# EasyEDA Pro project ProPrj_CraftVia-Core-S-RP235xA-v1-Rev0_2026-11-04.epro, board PCB1
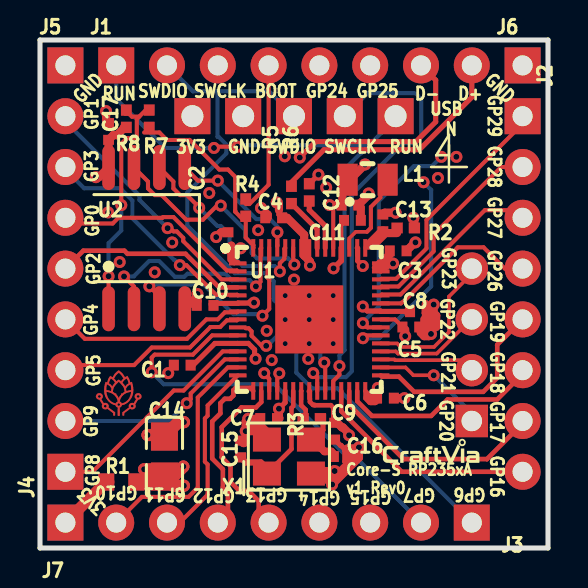
[diagram p2: board, top side]
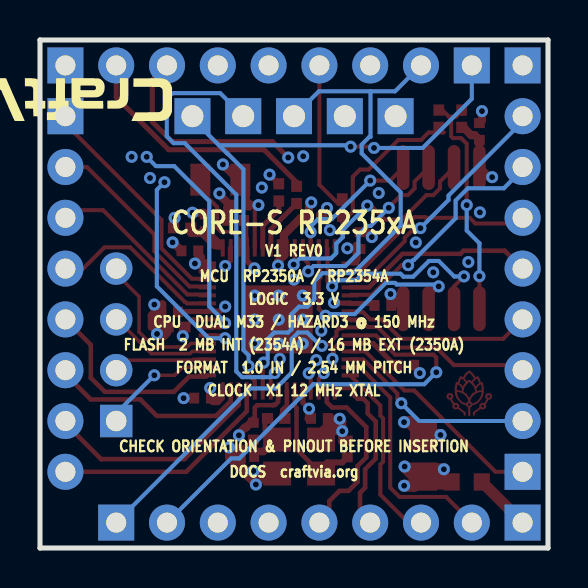
[diagram p3: board, bottom side, seen from below]

Outline 25.4 x 25.4 mm; copper layers: Top Layer, GND Plane, Power / Signal, Bottom Layer. Coordinates in mm from the lower left corner of the outline.
Outline path: 0,25.4 25.4,25.4 25.4,0 0,0 0,25.4
Stack: Top Layer 0.035mm Outer layer thickness 1oz / Dielectric1 0.2104mm 7628 RC49% 8.6mil / GND Plane 0.0175mm / Dielectric2 1.065mm 1.1mm H/HOZ Copper / Power / Signal 0.0175mm / Dielectric3 0.2104mm 7628 RC49% 8.6mil / Bottom Layer 0.035mm Outer layer thickness 1oz

## Design rules (mm)
net GND: PWR_MAIN
net USB_DM: USB, USB_IO
net USB_DP: USB, USB_IO
net +3V3_IN: PWR_MAIN
net +3V3_CORE: PWR_MAIN
net +1V1: PWR_MAIN
net VREG_AVDD: ANALOG_POWER
net XIN: CLOCK
net XOUT_XTAL: CLOCK
net VREG_LX: PWR_SWITCH
net XOUT: CLOCK
net USB_DP_MCU: USB, USB_MCU
net USB_DM_MCU: USB, USB_MCU
spacing copperThickness1oz (default): track to track 0.152, other pairs 0.152 to 0.3
spacing copperThickness2oz: track to track 0.203, other pairs 0.152 to 0.3
track width copperThickness1oz (default): min 0.152, default 0.203, max 2.54
track width copperThickness2oz: min 0.203, default 0.254, max 2.54
track width powerTrack: min 0.178, default 0.406, max 2.54
track width gndTrack: min 0.178, default 0.406, max 2.54
track width corePowerTrack: min 0.178, default 0.406, max 2.54
differential pair differentialPair (default): width min 0.127, default 0.254, max 2.54; gap min 0.152, default 0.152
net GND uses powerTrack
net +3V3_IN uses powerTrack
net +3V3_CORE uses copperRegion, powerTrack
net +1V1 uses copperRegion, powerTrack
net VREG_AVDD uses powerTrack
net VREG_LX uses powerTrack
net class PWR_MAIN uses powerTrack
net class PWR_SWITCH uses powerTrack
net class ANALOG_POWER uses powerTrack

## Placement (name value [footprint] x y rotation side)
C1  100n  [C0402]  7.11 9.14 180 top
C2  100n  [C0402]  9.4 15.37 90 top
C3  100n  [C0402]  17.91 14.86 0 top
C4  100n  [C0402]  11.68 16.51 180 top
C5  100n  [C0402]  18.54 11.05 0 top
C6  100n  [C0402]  17.27 7.49 0 top
C7  100n  [C0402]  11.43 6.48 180 top
C8  100n  [C0402]  18.92 11.81 0 top
C9  100n  [C0402]  14.73 5.84 270 top
C10  100n  [C0402]  8.25 12.13 180 top
C11  4.7u  [C0402]  15.62 16.38 0 top
C12  4.7u  [C0402]  15.49 17.14 0 top
C13  4.7u  [C0402]  17.15 16.26 90 top
C14  10u  [C0805]  6.22 4.57 90 top
C15  15p  [C0402]  10.03 4.95 90 top
C16  15p  [C0402]  15.11 4.57 0 top
C17  100nF  [C0402]  3.43 20.83 270 top
J1  N 1-8  [HDR-TH_8P-P2.54-V-M]  12.7 24.13 0 top
J2  E 1-8  [HDR-TH_8P-P2.54-V-M]  24.13 12.7 270 top
J3  S 1-8  [HDR-TH_8P-P2.54-V-M]  12.7 1.27 180 top
J4  W 1-8  [HDR-TH_8P-P2.54-V-M]  1.27 12.7 90 top
J5  K-NW  [CraftVia-Core-S-KEY-TH_1P-P2.54-D1.00-P1.80]  1.27 24.13 0 top
J6  K-NE  [CraftVia-Core-S-KEY-TH_1P-P2.54-D1.00-P1.80]  24.13 24.13 0 top
J7  K-SW  [CraftVia-Core-S-KEY-TH_1P-P2.54-D1.00-P1.80]  1.27 1.27 0 top
J8  AUX GPIO20-23 / 2.54mm PTH  [HDR-TH_HDR-M_2.54_1X4P]  21.59 10.16 90 top
L1  3.3uH  [IND-SMD_L2.0-W1.6_AOTA-B201610S3R3-101-T]  16.38 18.42 180 top
R1  0R  [R0603]  4.06 3.3 0 top
R2  33  [R0402]  18.29 16 180 top
R3  1k  [R0402]  13.59 6.48 180 top
R4  1k  [R0402]  10.29 17.02 90 top
R5  27  [R0402]  12.57 17.65 270 top
R6  27  [R0402]  13.46 17.78 270 top
R7  0Ω  [R0402]  5.46 21.46 90 top
R8  10kΩ  [R0402]  4.32 21.46 90 top
TP1  VTREF (+3V3_CORE)  [HDR-TH_1P-P2.54-V-M]  7.62 21.59 0 top
TP2  GND  [HDR-TH_1P-P2.54-V-M]  10.16 21.59 0 top
TP3  SWDIO  [HDR-TH_1P-P2.54-V-M]  12.7 21.59 0 top
TP4  SWCLK  [HDR-TH_1P-P2.54-V-M]  15.24 21.59 0 top
TP5  RUN  [HDR-TH_1P-P2.54-V-M]  17.78 21.59 0 top
U1  RP2354A  [QFN-60_L7.0-W7.0-P0.40-TL-EP3.4]  13.46 11.43 0 top
U2  W25Q128JVSIQ (RP2350A ONLY / DNP FOR RP2354A)  [SOIC-8_L5.3-W5.3-P1.27-LS8.0-BL]  5.33 15.49 0 top
X1  12MHz  [CRYSTAL-SMD_4P-L3.2-W2.5-BL]  12.45 4.57 0 top

## Footprints (pads in the part's own frame, mm; a bottom-side part is the same pattern mirrored in y, then rotated)
C0402
  rect 0.5x0.54 smd: 1(-0.42,0) 2(0.42,0)
C0805
  rect 1.41x1.35 smd: 1(-1,0) 2(1,0)
CraftVia-Core-S-KEY-TH_1P-P2.54-D1.00-P1.80
  rect 1.801x1.801 hole 1: 1(0,0)
CRYSTAL-SMD_4P-L3.2-W2.5-BL
  rect 1.4x1.2 smd: 1(-1.1,-0.85) 2(1.1,-0.85) 3(1.1,0.85) 4(-1.1,0.85)
HDR-TH_1P-P2.54-V-M
  rect 1.8x1.8 hole 1.1: 1(0,0)
HDR-TH_8P-P2.54-V-M
  rect 1.8x1.8 hole 1: 1(-8.89,0)
  round 1.801 hole 1: 2(-6.35,0) 3(-3.81,0) 4(-1.27,0) 5(1.27,0) 6(3.81,0) 7(6.35,0) 8(8.89,0)
HDR-TH_HDR-M_2.54_1X4P
  rect 1.62x1.62 hole 1.02: 1(-3.81,0)
  round 1.62 hole 1.02: 2(-1.27,0) 3(1.27,0) 4(3.81,0)
IND-SMD_L2.0-W1.6_AOTA-B201610S3R3-101-T
  rect 1x1.6 smd: 1(-1,0) 2(1,0)
QFN-60_L7.0-W7.0-P0.40-TL-EP3.4
  rect 0.875x0.2 smd: 1(-3.575,2.8) 2(-3.575,2.4) 3(-3.575,2) 4(-3.575,1.6) 5(-3.575,1.2) 6(-3.575,0.8) 7(-3.575,0.4) 8(-3.575,0) 9(-3.575,-0.4) 10(-3.575,-0.8) 11(-3.575,-1.2) 12(-3.575,-1.6) 13(-3.575,-2) 14(-3.575,-2.4) 15(-3.575,-2.8) 31(3.575,-2.8) 32(3.575,-2.4) 33(3.575,-2.001) 34(3.575,-1.6) 35(3.575,-1.2) 36(3.575,-0.8) 37(3.575,-0.4) 38(3.575,-0.001) 39(3.575,0.4) 40(3.575,0.8) 41(3.575,1.2) 42(3.575,1.6) 43(3.575,2) 44(3.575,2.4) 45(3.575,2.8)
  rect 0.2x0.875 smd: 16(-2.8,-3.575) 17(-2.4,-3.575) 18(-2,-3.575) 19(-1.6,-3.575) 20(-1.2,-3.575) 21(-0.8,-3.575) 22(-0.4,-3.575) 23(0,-3.575) 24(0.4,-3.575) 25(0.8,-3.575) 26(1.2,-3.575) 27(1.6,-3.575) 28(2,-3.575) 29(2.4,-3.575) 30(2.8,-3.575) 46(2.8,3.575) 47(2.4,3.575) 48(2,3.575) 49(1.6,3.575) 50(1.2,3.575) 51(0.8,3.575) 52(0.4,3.575) 53(0,3.575) 54(-0.4,3.575) 55(-0.8,3.575) 56(-1.2,3.575) 57(-1.6,3.575) 58(-2,3.575) 59(-2.4,3.575) 60(-2.8,3.575)
  rect 3.4x3.4 smd: 61(0,0)
R0402
  rect 0.566x0.54 smd: 1(-0.433,0) 2(0.433,0)
R0603
  rect 0.806x0.864 smd: 1(-0.753,0) 2(0.753,0)
SOIC-8_L5.3-W5.3-P1.27-LS8.0-BL
  oval 0.63x2.25 smd: 1(-1.905,-3.53) 2(-0.635,-3.53) 3(0.635,-3.53) 4(1.905,-3.53) 5(1.905,3.53) 6(0.635,3.53) 7(-0.635,3.53) 8(-1.905,3.53)

## Nets
As in the schematic.

## Via types
v1: diameter 0.6, hole 0.25, Top Layer to Bottom Layer, 9 vias
v2: diameter 0.6, hole 0.3, Top Layer to Bottom Layer, 79 vias
v3: diameter 0.6, hole 0.299, Top Layer to Bottom Layer, 4 vias

## Routing (per net, layer and track width the routed paths; a pad name or vN(x,y) marks a point on that pad's centre or on a via; arc(x,y) is an arc through that point)
+1V1: length 43.1
  Top Layer w0.203: 14.66,15 14.66,16.87 ; 15.11,17.32 15.01,17.21
  Top Layer w0.229: 14.73,6.39 14.66,6.46 14.66,7.02 14.54,7.14 13.74,7.14 13.73,7.15 13.65,7.15 13.5,7.31 13.49,7.84 13.44,7.84
  Top Layer w0.254: 10.73,12.33 10.52,12.33 10.44,12.25 9.91,12.25 U1.6 8.59,12.23 8.55,12.19 ; C8.1 18.25,11.81 18.23,11.83 U1.39 17.02,11.85 16.36,11.85 v2(16.14,12.07)
  Top Layer w0.406: v2(14.48,17.14) 14.94,17.14 15.01,17.21 C12.1 ; v2(15.45,5.64) 15.45,5.72 15.15,6.03 15.09,6.03 14.73,6.39 ; 15.11,17.32 15.11,18.27 15.26,18.42 ; v2(16.26,19.18) 15.49,18.42
  Power / Signal w0.178: 12.87,12.56 12.87,12.67 12.92,12.72 12.92,12.84 13.24,13.16 13.37,13.16 13.5,13.3
  Power / Signal w0.254: 12.97,12.04 12.02,12.04 11.79,12.27 v2(10.7,12.27)
  Power / Signal w0.28: 12.97,12.04 12.87,12.14 12.87,12.56 ; 12.97,12.04 12.85,11.93 12.85,11.17 13.2,10.83 14.04,10.83 ; 12.97,12.04 12.98,12.03 14.05,12.03 ; 12.7,10.67 12.85,10.51 12.85,9.97 12.7,9.82 12.7,9.65 ; 14.05,12.03 14.05,12.83 ; 14.05,12.03 14.05,10.84 14.04,10.83 ; 14.22,12.03 15.58,12.03 15.62,12.06 ; 14.04,10.83 15.35,10.83 15.49,10.96
  Power / Signal w0.406: v2(16.26,19.18) 14.96,17.89 14.96,17.75 14.48,17.27 v2(14.48,17.14) 14.48,14.68 14.34,14.54 arc(15.24,14.32) 15.02,13.42 arc(14.94,13.38) 14.86,13.35 v2(16.14,12.07) 15.96,11.9 15.87,11.9 15.32,11.34 15.32,11.13 15.49,10.96 15.49,9.51 15.63,9.37 15.63,8.83 15.45,8.65 v2(15.45,5.64)
+3V3_CORE: length 29.3
  Top Layer w0.178: 15.06,15 15.07,15.02 ; 15.07,15.48 15.07,16.38
  Top Layer w0.203: U1.38 17.75,11.43 18.26,10.92 ; U1.30 16.28,7.86 16.64,7.49 C6.1
  Top Layer w0.229: U1.44 17.3,14.1
  Top Layer w0.254: v2(11.95,6.97) 12.26,7.27 12.26,7.85 ; C4.1 11.95,16.67 11.95,16.89 ; C1.1 7.66,9.14 8.75,10.23 U1.11 10.42,10.23 10.73,9.92 10.73,9.51 v2(10.78,9.46) ; 9.72,14.29 9.89,14.29 ; 15.07,15.02 15.07,15.48
  Top Layer w0.28: 15.06,15 15.06,14.37 v2(14.68,13.98)
  Top Layer w0.305: 9.57,14.44 9.72,14.29
  Top Layer w0.406: 9.57,14.44 9.57,15.12 C2.1 ; 17.3,14.1 17.04,14.1 17.16,14.22 ; 11.98,6.48 11.95,6.51 v2(11.95,6.97) ; 17.34,14.53 17.49,14.68 C3.1 ; 17.16,14.22 17,14.22 16.8,14.02 ; 17.16,14.22 v2(17.65,14.22) ; 4.19,21.03 4.19,20.99 3.85,20.64 3.66,20.64 C17.2 U2.8 2.95,18.54 v2(2.79,18.54) ; 11.95,16.89 11.95,17.17 v2(11.84,17.28) ; 18.26,10.92 v2(18.26,10.59) ; 16.38,7.5 16.53,7.34 16.74,7.34 16.89,7.49 v2(16.89,8) ; 12.23,16.51 12.36,16.51 13.21,15.66 13.21,14.62 13.21,14.62 13.41,14.42 13.41,14.42 13.5,14.33 v2(13.5,14.12) ; v2(18.67,16.51) 18.72,16.46 R2.1
  Top Layer w0.61: C14.1 6.67,3.57 v2(7.17,4.07) ; C14.1 6.68,3.11 v2(7.19,3.11) ; C14.1 5.86,3.94 v2(5.21,3.94)
  Top Layer w0.762: 4.94,3.3 5.95,3.3 ; 5.95,3.3 6.08,3.3 ; 5.95,3.3 C14.1
  Power / Signal w0.406: v2(14.68,13.98) 14.67,13.98 14.1,13.98 13.96,14.12 v2(13.5,14.12)
  vias: v2(10.03,14.99)
+3V3_IN: length 2.9
  Top Layer w0.559: 3.43,3.3 3.44,3.3 ; J7.1 3.3,3.3
GND: length 26.7
  Top Layer w0.254: 15.86,15 15.88,14.98 15.88,14.36 v2(16.14,14.1) ; C9.2 15.03,5.12 15.06,5.12 15.22,4.96 15.22,4.93 15.24,4.91 15.24,4.32 15.38,4.18
  Top Layer w0.406: 10.54,5.97 10.72,6.15 ; 13.8,3.85 14.31,3.85 14.31,3.47 v2(14.6,3.17) 14.66,3.23 ; v2(16.43,17.73) 16.43,17.66 C12.2 16.04,17.02 C11.2 ; C13.2 17.23,16.76 v2(17.78,16.76) ; v2(19.55,10.7) 19.55,11.35 19.34,11.56 19.34,11.76 ; v2(19.55,10.7) 19.44,10.59 19.21,10.59 19.04,10.76 ; v2(19.55,10.7) 19.22,11.04 19.22,11.43 ; 7.87,12.6 U2.4 ; 7.87,12.6 v2(7.87,12.7) ; 7.87,12.6 7.87,12.36 7.71,12.19 ; 19.56,11.92 19.43,11.92 ; 19.56,11.92 19.4,11.76 19.34,11.76 ; 19.56,11.92 19.56,12.04 v2(19.69,12.17) 19.69,11.75 19.81,11.62 19.81,11.05 ; 15.37,4.98 15.9,4.98 v2(15.95,5.03) 15.95,4.52 14.66,3.23 ; 14.66,3.23 14.66,3.77 v2(14.73,3.85) 15.06,3.85 15.38,4.18 15.53,4.33 15.53,4.7 ; v2(10.29,5.84) 10.29,6.33 v2(10.41,6.46) 10.99,6.46 C7.2 ; v2(10.29,5.84) 10.93,5.84 11.05,5.72 ; v2(10.29,5.84) 10.29,5.33 10.2,5.25 10.16,5.25 ; v2(8.81,15.55) 9.05,15.79 C2.2 ; v2(3.3,21.84) 3.3,21.38 C17.1 ; 11.05,6.1 11.35,5.8 X1.4 ; C6.2 v2(18.22,7.49) ; v2(11.05,17) 11.39,16.66 11.39,16.51 ; 19.34,11.76 19.29,11.76 19.29,12.19 ; 19.34,11.76 C8.2 ; C3.2 18.75,15.28 v2(18.77,15.28)
  Top Layer w0.61: v2(5.38,5.65) 6.27,5.65 6.91,6.29 v2(7.2,6.29)
  vias: v1(12.26,12.62) v1(12.26,11.42) v1(12.26,10.22) v1(13.46,12.62) v1(13.46,11.42) v1(13.46,10.22) v1(14.66,12.62) v1(14.66,11.42) v1(14.66,10.22) v2(3.41,16.78) v2(3.98,14.3) v2(5.74,13.78) v2(6.41,8.74) v2(6.61,15.28) v2(8.46,17.75) v2(10.91,15.89) v2(11.34,10.86) v2(11.59,9.39) v2(12.7,13.42) v2(13.41,9.46) v2(14.31,18.02) v2(19.9,18.5) v2(20.82,19.56) v3(12.24,19.59)
BOOTSEL_REQ: length 7.5
  Top Layer w0.203: 10.29,17.2 10.47,17.2 11.43,18.16 J1.4
CV_E1_GPIO29_ADC3: length 11.5
  Top Layer w0.203: J2.1 24.13,21.21 19.33,16.4 19.33,14.98 17.81,13.46 17.07,13.46 U1.43
CV_E2_GPIO28_ADC2: length 10.1
  Top Layer w0.203: J2.2 23.06,19.05 19.68,15.67 19.68,14.83 17.92,13.07 17.08,13.07 U1.42
CV_E3_GPIO27_ADC1: length 9
  Top Layer w0.203: U1.41 17.08,12.67 18.03,12.67 22.24,16.89 23.75,16.89 J2.3
CV_E4_GPIO26_ADC0: length 8.7
  Top Layer w0.203: J2.4 23.24,13.97 22.18,15.03 20.89,15.03 18.18,12.32 arc(18.11,12.29) 18.05,12.23 U1.40
CV_E5_GPIO19: length 9.9
  Top Layer w0.229: U1.31 17.1,8.57 17.95,8.57 18.71,7.81 22.16,7.81 22.86,8.51 22.86,10.16 J2.5
CV_E6_GPIO18: length 10.1
  Top Layer w0.229: U1.29 15.86,7.34 16.6,6.6 19.56,6.6 20.38,7.43 22.86,7.43 24.13,8.7 J2.6
CV_E7_GPIO17: length 11.4
  Top Layer w0.229: 22.35,4.44 22.35,4.44 ; 22.35,4.44 18.18,4.44 15.46,7.16 U1.28 ; 22.35,4.44 24.13,6.23 J2.7
CV_E8_GPIO16: length 11.3
  Top Layer w0.229: J2.8 18.09,3.81 15.06,6.84 U1.27
CV_S1_GPIO6: length 17
  Top Layer w0.203: 10.29,10.98 10.43,10.98 10.58,10.83 10.58,10.61 11.08,10.11 v2(11.31,10.11)
  Bottom Layer w0.203: J3.1 14.88,7.98 13.6,7.98 12.82,8.77 12.82,10.45 12.49,10.77 12.03,10.77 11.57,10.31 11.51,10.31 v2(11.31,10.11)
CV_S2_GPIO7: length 22.1
  Top Layer w0.203: U1.10 8.61,10.63 7.64,9.67 5.73,9.67 5.59,9.52 v2(5.59,8.79)
  Bottom Layer w0.203: J3.2 15.84,4.48 15.44,4.48 11.73,8.19 6.18,8.19 v2(5.59,8.79)
CV_S3_GPIO15: length 10.8
  Top Layer w0.203: v2(11.96,8.73) 11.86,8.63 U1.19
  Power / Signal w0.229: J3.3 15.17,2.61 14.24,2.61 13.84,3.01 13.84,6.65 11.96,8.53 v2(11.96,8.73)
CV_S4_GPIO14: length 10.1
  Top Layer w0.203: U1.18 11.46,8.45 11.41,8.5 11.41,8.54 v2(11.21,8.74)
  Power / Signal w0.229: J3.4 13.97,2.03 12.7,3.3 12.7,4.83 13.34,5.46 13.34,6.48 11.21,8.6 v2(11.21,8.74)
CV_S5_GPIO13: length 9.1
  Top Layer w0.229: J3.5 10.94,1.77 10.94,2.35 10.43,2.86 9.97,2.86 9.53,3.3 9.53,4.09 9.09,4.53 9.09,6.04 10.07,7.03 10.79,7.03 11.06,7.29 U1.17
CV_S6_GPIO12: length 8.9
  Top Layer w0.229: U1.16 10.52,8 9.78,8 9.67,7.89 9.67,7.62 9.51,7.46 9.24,7.46 9.02,7.24 9.02,6.73 8.61,6.33 8.61,4.47 9.14,3.94 9.14,3.02 9.4,2.76 9.4,1.78 J3.6
CV_S7_GPIO11: length 9.3
  Top Layer w0.203: U1.15 8.38,7.12 8.38,6.62 8.24,6.48 8.24,4.32 8.38,4.18 8.38,2.67 6.99,1.27 6.35,1.27
CV_S8_GPIO10: length 11.9
  Top Layer w0.203: J3.8 5.09,2.55 7.42,2.55 7.89,3.02 7.89,7.53 9.39,9.03 U1.14
CV_W1_GPIO8: length 11.1
  Top Layer w0.203: J4.1 2.62,3.81 5.16,6.35 5.19,6.35 5.33,6.5 5.33,6.52 6.69,7.87 7.18,7.87 9.13,9.83 U1.12
CV_W2_GPIO9: length 9.9
  Top Layer w0.203: U1.13 9.24,9.43 7.53,7.72 7.53,7.44 v2(7.33,7.24)
  Bottom Layer w0.203: J4.2 6.32,6.35 ; 6.45,6.35 v2(7.33,7.24)
CV_W3_GPIO5: length 9.7
  Top Layer w0.203: U1.8 9.84,11.38 9.34,11.38 9.01,11.05 8.52,11.05 7.5,10.02 5.58,10.02 4.7,9.14 1.52,9.14 J4.3
CV_W4_GPIO4: length 9.6
  Top Layer w0.203: J4.4 2.24,10.46 7.35,10.46 8.32,11.43 8.89,11.43 9.24,11.79 9.84,11.79 U1.7
CV_W5_GPIO2: length 9.7
  Top Layer w0.229: U1.4 8.95,13.03 7.27,14.71 4.37,14.71 4.22,14.86 2.16,14.86 J4.5
CV_W6_GPIO0: length 10
  Top Layer w0.203: U1.2 9.84,13.88 9.34,13.88 6.67,16.55 6.15,16.55 6.11,16.51 3.92,16.51 3.64,16.23 1.81,16.23 1.52,16.51 J4.6
CV_W7_GPIO3: length 11.9
  Top Layer w0.203: v2(6.99,14.14) 7.32,14.14 8.8,12.66 9.86,12.66 U1.5
  Bottom Layer w0.203: v2(6.99,14.14) 6.73,14.4 6.7,14.4 4.62,16.49 4.62,17.37 4,17.99 2.21,17.99 1.27,18.92 J4.7
CV_W8_GPIO1: length 12.4
  Top Layer w0.203: U1.3 9.07,13.43 7.16,15.34 7.16,15.51 6.84,15.83 6.67,15.83 6.51,15.99 v2(6.38,15.99)
  Bottom Layer w0.203: v2(6.38,15.99) 4.97,17.4 4.97,17.62 1.27,21.33 J4.8
FLASH_CS_EXT: length 11.9
  Top Layer w0.203: v2(4.06,17.14) 4.06,20.21 4.34,20.49 4.75,20.49 4.84,20.59 4.84,21.45 4.96,21.57 ; 4.19,21.9 4.19,21.79 4.27,21.72 4.44,21.72 4.59,21.57 4.96,21.57 ; 4.96,21.57 5.29,21.9 5.33,21.9 ; U2.1 v2(3.43,13.59)
  Bottom Layer w0.203: v2(3.43,13.59) 3.43,15.24 4.06,15.88 v2(4.06,17.14)
GPIO20: length 5.9
  Top Layer w0.178: U1.32 18.28,9.03 18.67,8.64 v2(19.69,8.64)
  Bottom Layer w0.203: 21.72,6.35 21.72,6.6 v2(19.69,8.64)
GPIO21: length 5
  Top Layer w0.178: 21.72,8.89 21.72,9.09 21.42,9.39 17.76,9.39 17.72,9.43 U1.33
GPIO22: length 5.4
  Top Layer w0.178: 21.72,11.43 21.54,11.43 19.84,9.72 17.9,9.72 17.79,9.83 U1.34
GPIO23: length 7.5
  Top Layer w0.178: 21.72,13.97 21.72,13.84 20.45,12.57 20.45,10.8 19.7,10.05 18.04,10.05 17.86,10.23 17.04,10.23 U1.35
GPIO24: length 19.9
  Top Layer w0.203: v2(16.15,10.49) 16.29,10.63 U1.36
  Power / Signal w0.203: v2(19.18,18.29) 19.18,19.05 17.79,20.44 16.71,20.44 16.51,20.64 16.51,22.48 16.13,22.86 15.24,22.86 J1.5
  Bottom Layer w0.203: v2(19.18,18.29) 19.56,17.91 19.56,13.08 16.97,10.49 v2(16.15,10.49)
GPIO25: length 18
  Top Layer w0.203: v2(16.14,11.24) 16.34,11.04 16.38,11.04 16.39,11.03 U1.37
  Power / Signal w0.203: J1.6 17.89,22.75 18.81,22.75 19.18,22.37 19.18,21.59 20.07,20.7 v2(20.07,19.56)
  Bottom Layer w0.203: v2(16.14,11.24) 16.14,11.29 16.94,12.09 16.94,17.34 18.69,19.1 19.6,19.1 v2(20.07,19.56)
QSPI_SCLK: length 10.2
  Top Layer w0.203: v2(7.96,17.01) 7.96,17.03 7.35,17.64 7,17.64 6.67,17.98 6.67,18.32 U2.6 ; 12.26,15 12.22,14.96 12.22,14.46 11.99,14.24 v2(11.99,13.83)
  Bottom Layer w0.203: v2(7.96,17.01) 8.87,16.1 9.04,16.1 9.48,15.66 9.48,14.76 10.14,14.1 11.73,14.1 v2(11.99,13.83)
QSPI_SD0: length 6.8
  Top Layer w0.203: v2(11.87,15.79) 11.87,15.11 11.86,15.11 ; U2.5 7.89,18.37 v2(8.89,18.37)
  Bottom Layer w0.203: v2(8.89,18.37) 10.81,16.45 11.49,16.45 11.87,16.07 v2(11.87,15.79)
QSPI_SD1: length 11.4
  Top Layer w0.203: U2.2 4.7,13.08 v2(4.2,13.58) ; 11.06,15 11.02,14.97 11.02,13.31 v2(10.79,13.08)
  Bottom Layer w0.203: v2(10.79,13.08) 10.49,13.39 9.6,13.39 9.27,13.72 7.37,13.72 7.22,13.56 6.74,13.56 5.95,14.35 5.46,14.35 4.69,13.58 v2(4.2,13.58)
QSPI_SD2: length 11.3
  Top Layer w0.203: U2.3 5.97,12.58 v2(5.47,13.08) ; v2(11.12,11.61) 11.46,11.95 11.46,13.43 11.38,13.51 11.38,14.09 11.46,14.17 11.46,15
  Bottom Layer w0.203: v2(11.12,11.61) 10.99,11.61 10.91,11.69 9.67,11.69 8.1,13.25 7.64,13.25 7.56,13.17 5.56,13.17 v2(5.47,13.08)
QSPI_SD3: length 12.2
  Top Layer w0.203: v2(12.72,14.17) 12.66,14.23 12.66,15 ; U2.7 5.4,18.32 5.4,17.98 5.73,17.64 6.08,17.64 7.31,16.42 8.15,16.42 8.85,17.12 v2(9.04,17.12)
  Bottom Layer w0.203: v2(9.04,17.12) 10.26,15.89 10.26,15.54 10.59,15.22 10.59,14.75 10.85,14.48 12.41,14.48 v2(12.72,14.17)
QSPI_SS: length 9.4
  Top Layer w0.203: R4.1 10.16,16.46 10.11,16.46 9.76,16.81 9.76,16.86 9.76,16.86 9.76,18.56 9.4,18.92 8.96,18.92 7.48,20.4 6.34,20.4 5.97,20.78 5.21,20.78 ; 10.29,16.33 10.29,15.52 10.67,15.13 10.67,15.01 10.66,15
RUN: length 30.5
  Top Layer w0.203: v2(9.87,20.07) 8.76,20.07 v2(8.7,20) ; U1.26 14.66,8.35 14.97,8.66 v3(14.97,9.1)
  Bottom Layer w0.203: v2(8.7,20) 6.26,20 3.81,22.46 J1.1 ; 16.45,20.14 17.91,21.59 ; 16.45,20.14 16.05,19.73 16.03,19.73 15.23,18.93 15.23,9.9 14.97,9.64 v3(14.97,9.1) ; 16.45,20.14 9.94,20.14 v2(9.87,20.07)
SWCLK: length 30.5
  Top Layer w0.203: v3(13.66,8.74) 13.86,8.54 U1.24
  Power / Signal w0.203: J1.3 8.89,23.75 9.66,22.98 13.86,22.98 TP4.1
  Bottom Layer w0.203: v3(13.66,8.74) 13.86,8.54 15.29,8.54 15.59,8.83 15.59,17.67 18.16,20.24 18.72,20.24 19.06,20.58 19.06,20.64 ; 19.06,20.64 19.06,22.49 ; 19.06,20.64 19.05,20.63 ; TP4.1 16.39,22.75 18.68,22.75 arc(18.86,22.67) 18.93,22.49
SWDIO: length 27.8
  Top Layer w0.203: v3(14.21,9.27) 14.26,9.22 U1.25
  Bottom Layer w0.203: 8.87,22.83 8.87,20.56 8.93,20.56 9.32,20.17 9.32,19.73 7.37,17.78 7.37,16.12 9.74,13.74 11.28,13.74 11.68,13.33 11.68,12.45 11.71,12.42 11.71,12.39 12.03,12.07 12.45,12.07 12.83,11.68 12.83,10.94 12.99,10.77 13.69,10.77 14.02,10.45 14.02,9.47 v3(14.21,9.27) ; 8.87,22.83 7.65,22.83 J1.2 ; 8.87,22.83 11.46,22.83 TP3.1
USB_DM: length 12.7
  Top Layer w0.254: 13.59,18.09 13.59,18.34 v2(13.92,18.67) ; J1.7 19.78,23.39 19.78,21.31 18.8,20.32 13.79,20.32 v2(12.99,19.52)
  Power / Signal w0.254: v2(12.99,19.52) 13.84,18.67 v2(13.92,18.67)
USB_DM_MCU: length 2.7
  Top Layer w0.254: R6.2 13.46,16.91 14.26,16.11 14.26,15
USB_DP: length 12.6
  Top Layer w0.254: J1.8 21.59,22.54 18.96,19.91 14.2,19.91 12.57,18.29 R5.1
USB_DP_MCU: length 2.7
  Top Layer w0.254: 13.86,15 13.86,15.94 R5.2
VREG_AVDD: length 2.7
  Top Layer w0.178: 16.26,15 16.53,15 16.66,15.13
  Top Layer w0.406: 17.85,15.75 17.27,15.75 16.66,15.13
  Top Layer w0.482: 16.55,15.24 C13.1
VREG_LX: length 4.5
  Top Layer w0.178: 16.35,15.81 15.79,15.81 15.46,15.48 15.46,15
  Top Layer w0.203: L1.1 17.02,18.05 17.02,17.53 16.54,17.05 16.54,16.01 16.35,15.81
XIN: length 6.2
  Top Layer w0.203: 11.47,3.85 X1.1 ; 12.66,7.09 12.59,7.02
  Top Layer w0.229: U1.21 12.66,7.09 ; 12.59,7.02 12.57,7 12.57,4.95 11.47,3.85
  Top Layer w0.305: 11.47,3.85 11.04,4.28 10.29,4.28 10.16,4.41
XOUT: length 1.2
  Top Layer w0.229: U1.22 13.06,7.85 13.06,7.14 13.28,6.91 13.28,6.73
XOUT_XTAL: length 2.5
  Top Layer w0.254: R3.1 14.15,6.35 14.15,5.9 13.8,5.55
  Top Layer w0.381: 14.69,4.7 14.57,4.83 14.22,4.83 13.8,5.25 13.8,5.55

## Copper pours and planes (outline as drawn; the poured copper is in the pictures)
+1V1 on Power / Signal: 11.9,10.42 12.62,10.71 12.76,11.43 13.57,13.74 15.22,12.09 15.22,9.34 14.97,9.1 14.97,8.49 14.86,8.38 13.2,8.38 13.15,8.44 13.15,7.87
+1V1 on Power / Signal: 14.54,5.21 14.29,5.21 14.09,5.11 12.8,6.17 11.45,7.51 11.56,11.43 7.37,11.43 7.24,11.56 7.24,12.57 7.28,12.53 10.14,12.53 10.77,13.16 11.06,13.35 14.1,13.52 14.1,17.57 16.26,19.73 16.26,15.24 15.11,14.1 15.11,13.72 16.5,12.33 18.66,12.33 18.92,12.06 18.92,11.43 18.4,11.43 18.15,11.68 16.54,11.68 16.36,11.85 16.36,11.15 16,10.8 16.09,10.71 16.09,7.11 16.48,6.72 16.62,5.21 15.06,5.12 14.53,5.26
+3V3_CORE on Power / Signal: 0,25.38 25.4,25.38 25.4,0.02 0,0.02
GND on GND Plane: 0.26,25.14 25.14,25.14 25.14,0.26 0.26,0.26

Small or netless copper shapes (teardrops, artwork), in the pictures only: 3 on Top Layer, 4 on GND Plane

## Text on the board
Bottom Silkscreen Layer: V1 REV0 | MCU  RP2350A / RP2354A | LOGIC  3.3 V | CPU  DUAL M33 / HAZARD3 @ 150 MHz | FLASH  2 MB INT (2354A) / 16 MB EXT (2350A) | FORMAT  1.0 IN / 2.54 MM PITCH | CLOCK  X1 12 MHz XTAL | CHECK ORIENTATION & PINOUT BEFORE INSERTION | DOCS  craftvia.org | CORE-S RP235xA
Top Silkscreen Layer: Core-S RP235xA / v1 Rev0 | RUN | SWDIO | 3V3 | SWCLK | GND | BOOT | GP24 | GP25 | D- | USB | N | D+ | GP4 | GP9 | GP3 | GP1 | GP0 | GP8 | GP2 | GP5 | GP10 | GP11 | GP12 | GP13 | GP14 | GP15 | GP7 | GP6 | GP20 | GP22 | GP21 | GP23 | GP29 | GP28 | GP27 | GP26 | GP17 | GP19 | GP18 | GP16
